# Altium project DIGITAL_TWIN_SOC_TAG.PrjPcb
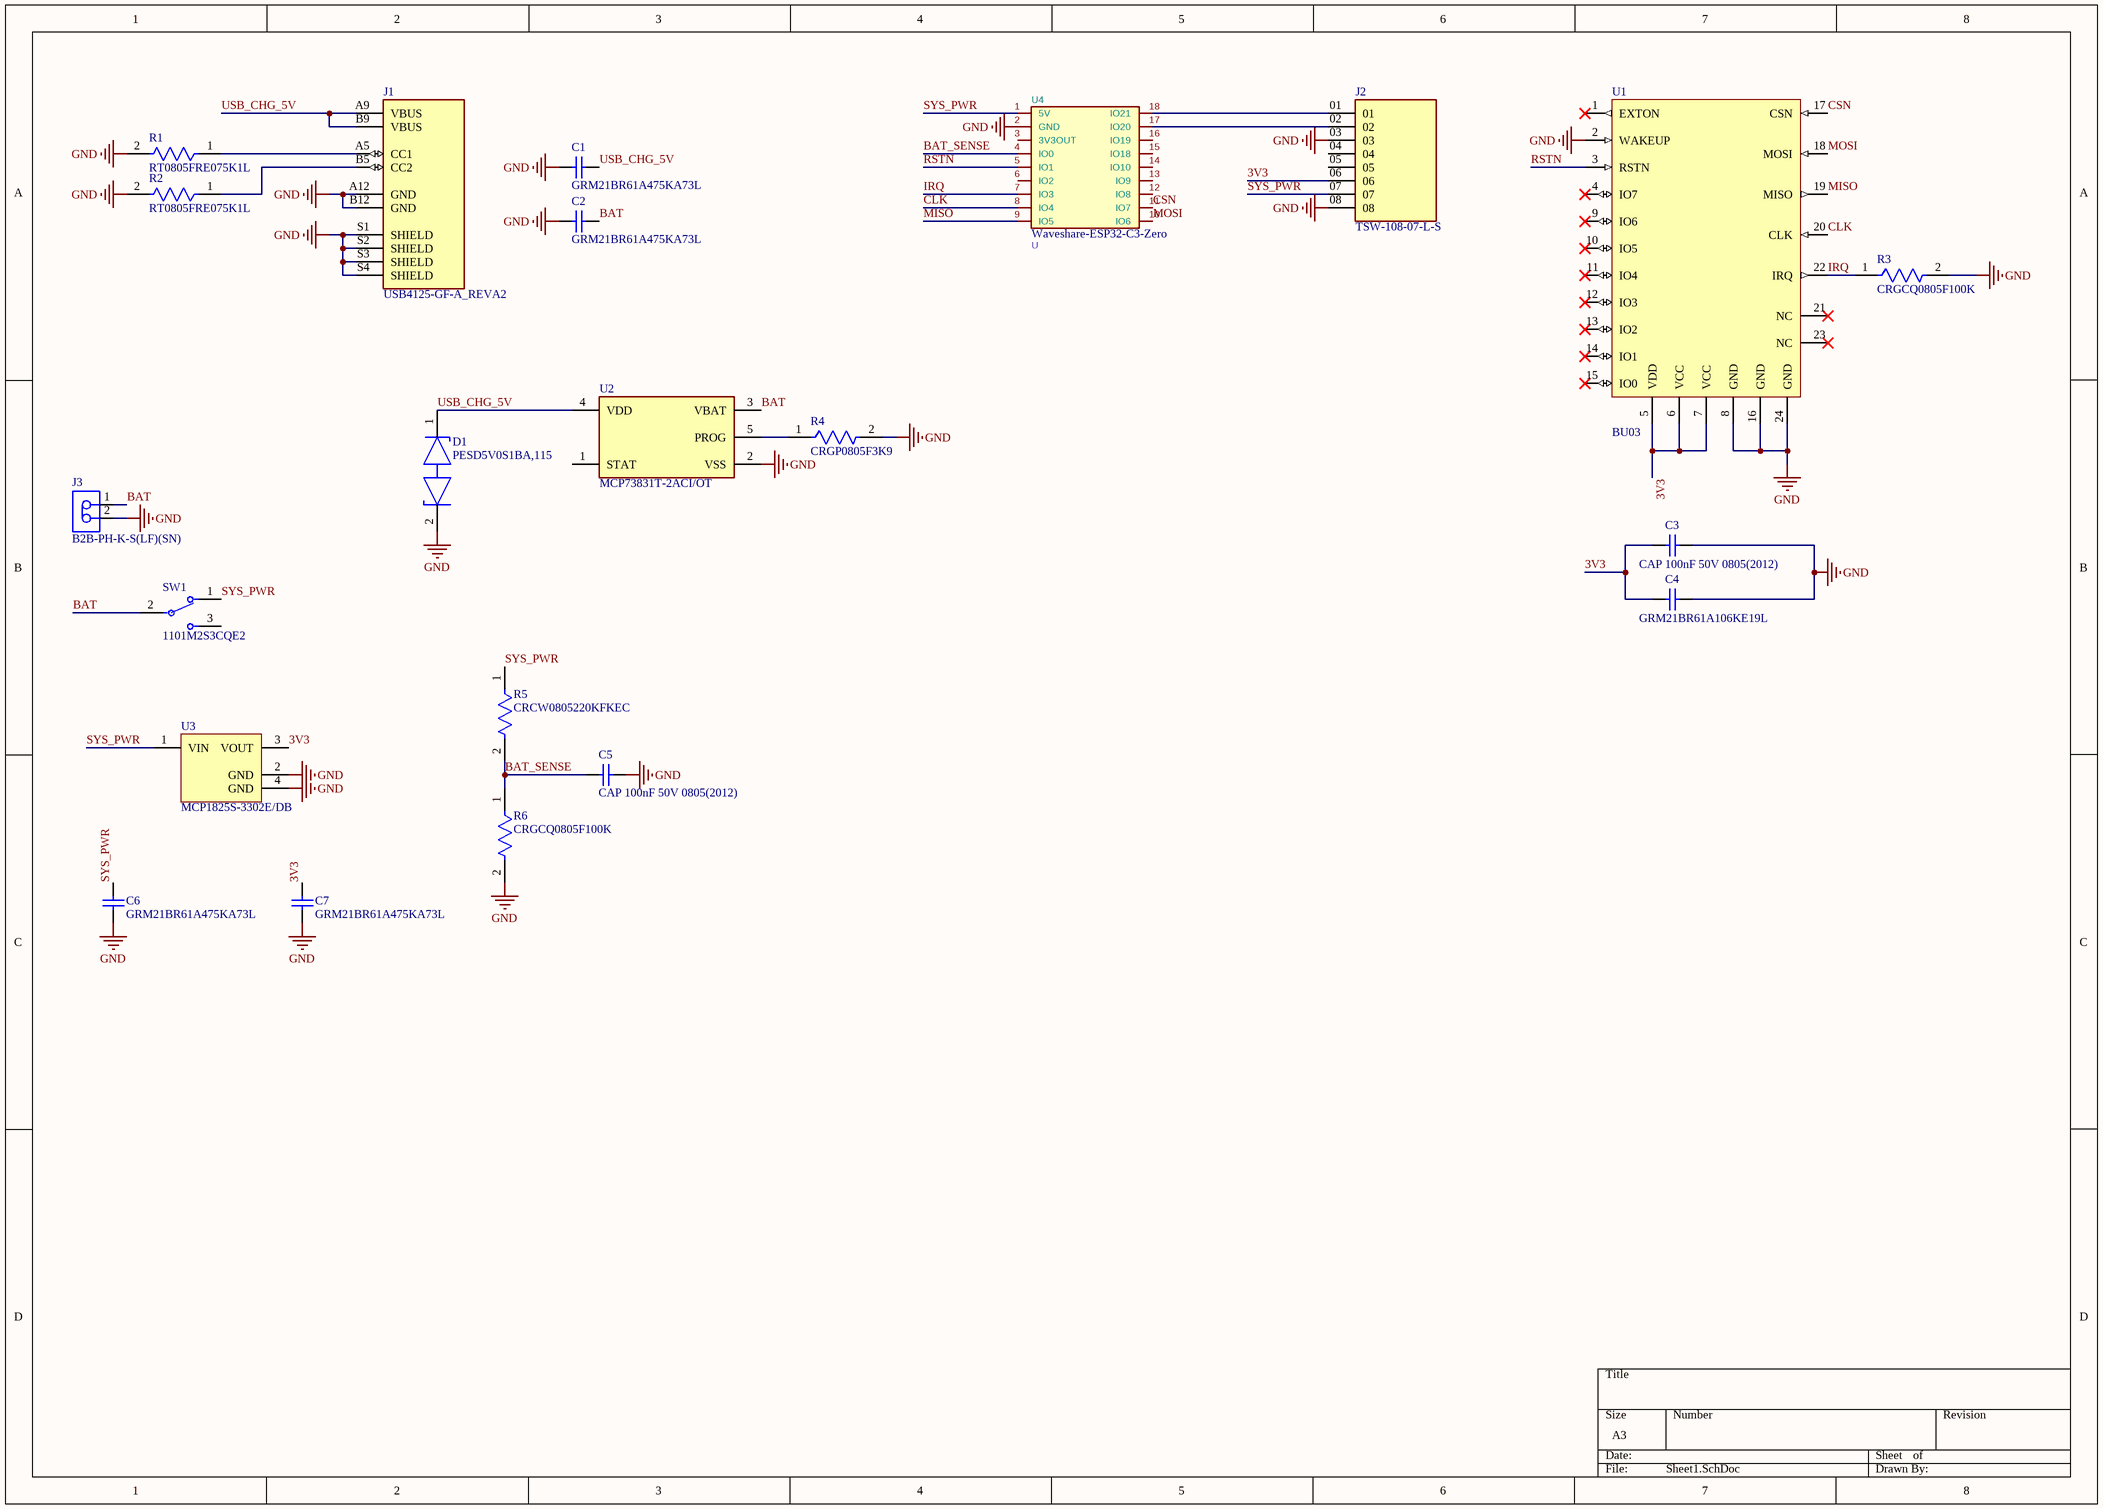
[diagram p0: Sheet1.SchDoc]
1 sheet, 22 parts. Net scope: global (net labels, ports and power ports of the same name join across sheets).
Board file: PCB1.PcbDoc

## Sheet Sheet1.SchDoc
size A3; SheetNumber: 1; SheetTotal: 1

### Parts
C1  GRM21BR61A475KA73L  [CAPC2013X140X45NL15T25]
C2  GRM21BR61A475KA73L  [CAPC2013X140X45NL15T25]
C3  CAP 100nF 50V 0805(2012)  [CAPC0805(2012)100_L]
C4  GRM21BR61A106KE19L  [MURA-0805_H_1.35_M]
C5  CAP 100nF 50V 0805(2012)  [CAPC0805(2012)100_L]
C6  GRM21BR61A475KA73L  [CAPC2013X140X45NL15T25]
C7  GRM21BR61A475KA73L  [CAPC2013X140X45NL15T25]
D1  PESD5V0S1BA,115  [FP-SOD323-CA-MFG]
J1  USB4125-GF-A_REVA2  [GCT_USB4125-GF-A_REVA2]
J2  TSW-108-07-L-S  [SAMTEC_TSW-108-07-L-S]
J3  B2B-PH-K-S(LF)(SN)  [JST-B2B-PH-K-S_V]
R1  RT0805FRE075K1L  [FP-RT0805-MFG]
R2  RT0805FRE075K1L  [FP-RT0805-MFG]
R3  CRGCQ0805F100K  [FP-CRGCQ0805-IPC_C]
R4  CRGP0805F3K9  [FP-CRGP0805-IPC_C]
R5  CRCW0805220KFKEC  [FP-CRCW0805-e3-IPC_B]
R6  CRGCQ0805F100K  [FP-CRGCQ0805-IPC_C]
SW1  1101M2S3CQE2  [FP-1101M2S3CQE2-MFG]
U1  BU03  [BU03-MODE-24PIN-T]
U2  MCP73831T-2ACI/OT  [FP-C04-091-OT-IPC_B]
U3  MCP1825S-3302E/DB  [SOT-223-DB3_N]
U4  Waveshare-ESP32-C3-Zero  Reference: U  [Waveshare-ESP32-C3-Zero]

### Nets
GND: C1.2 C2.2 C3.2 C4.1 C5.2 C6.2 C7.2 D1.2(K2) J1.A12(GND) J1.B12(GND) J1.S1(SHIELD) J1.S2(SHIELD) J1.S3(SHIELD) J1.S4(SHIELD) J2.03 J2.08 J3.2 R1.2 R2.2 R3.2 R4.2 R6.2 U1.2(WAKEUP) U1.8(GND) U1.16(GND) U1.24(GND) U2.2(VSS) U3.2(GND) U3.4(GND) U4.2(GND)
3V3: C3.1 C4.2 C7.1 J2.06 U1.5(VDD) U1.6(VCC) U1.7(VCC) U3.3(VOUT)
BAT: C2.1 J3.1 SW1.2(COMM) U2.3(VBAT)
BAT_SENSE: C5.1 R5.2 R6.1 U4.4(IO0)
CLK: U1.20(CLK) U4.8(IO4)
CSN: U1.17(CSN) U4.11(IO7)
IRQ: R3.1 U1.22(IRQ) U4.7(IO3)
MISO: U1.19(MISO) U4.9(IO5)
MOSI: U1.18(MOSI) U4.10(IO6)
RSTN: U1.3(RSTN) U4.5(IO1)
SYS_PWR: C6.1 J2.07 R5.1 SW1.1 U3.1(VIN) U4.1(5V)
USB_CHG_5V: C1.1 D1.1(K1) J1.A9(VBUS) J1.B9(VBUS) U2.4(VDD)
NetJ1_A5: J1.A5(CC1) R1.1
NetJ1_B5: J1.B5(CC2) R2.1
NetJ2_01: J2.01 U4.18(IO21)
NetJ2_02: J2.02 U4.17(IO20)
NetR4_1: R4.1 U2.5(PROG)

Not connected (* = marked no-connect by the designer): J2 04 05; SW1 3; U1 1(EXTON)* 4(IO7)* 9(IO6)* 10(IO5)* 11(IO4)* 12(IO3)* 13(IO2)* 14(IO1)* 15(IO0)* 21(NC)* 23(NC)*; U2 1(STAT); U4 3(3V3OUT) 6(IO2) 12(IO8) 13(IO9) 14(IO10) 15(IO18) 16(IO19)

### Library data of the parts
C1 C2 C6 C7 = CMP-2007-03391-1: Manufacturer: Murata; Part Number: GRM21BR61A475KA73L
C3 C5 = CMP-1036-04418-1: CAP 100nF 50V ±5% 0805 (2012 Metric) Thickness 1mm SMD; Case-EIA: 0805; Tolerance: Â±5%; Case-Metric: 2012; Max Thickness: 1 mm; Technology: SMT; Value: 100nF; Rated Voltage: 50 V
C4 = CMP-2000-05254-1: CAP, Ceramic, 10 uF, 10%, 10 V, 0805, RoHS, Tape and Reel; Manufacturer: Murata; Voltage - Rated: 10V; Product Training Modules: High-CapMultilayerCeramicCapacitors; Catalog Drawings: GRMSeries_0805_1.25; Temperature Coefficient: X5R; Online Catalog: GRMSeries; Featured Product: GA3SafetyRecognizedCapsandHi-CapMLCC; Capacitance: 10µF; Other Names: 490-1709-6; Applications: GeneralPurpose; Category: Capacitors; Datasheet Version: Aug-14; Datasheet URL: https://datasheet.ciiva.com/3777/210grm21br61a106ke1923-3777175.pdf; Ratings: -; Height - Seated (Max): -; Lead Spacing: -; Operating Temperature: -55degC~85degC; Features: -; Package Description: 2-Pin Surface Mount Device (0805), Body 2.1 x 1.35 mm; Standard Package: 1; Mounting Type: SurfaceMount,MLCC; Package Reference: 805; Tolerance: ±10%; Manufacturer URL: http://www.murata.com/; Size / Dimension: 0.079"Lx0.049"W(2.00mmx1.25mm); Packaging: Digi-Reel; Thickness (Max): 0.053"(1.35mm); Package / Case: 0805(2012Metric); Family: CeramicCapacitors; Series: GRM; Lead Style: -
D1 = CMP-14432-000001-1: TVS DIODE 5V 14V SOD323
J2 = TSW-108-07-L-S: MF: Samtec Inc.; Availability: Unavailable; Price: None; Package: None; Value: *; MP: TSW-108-07-L-S
J3 = CMP-2000-05162-1: Male Header, Pitch 2 mm, 1 x 2 Position, Height 6 mm, Tail Length 3.4 mm, -25 to 85 degC, RoHS, Bulk; Manufacturer: JST; Pitch: 2mm; Style/Orientation: StraightHeader/Plug; No of Positions: 2; Datasheet Version: Nov-08; Datasheet URL: http://datasheet.octopart.com/B2B-PH-K-S%28LF%29%28SN%29-JST-datasheet-8324864.pdf; Manufacturer URL: http://www.jst.com/home2.html; Type: ShroudedHeader; Termination: Crimp
R1 R2 = CMP-2001-01539-2: RES SMD 5.1K OHM 1% 1/8W 0805; Manufacturer: Yageo; Temperature Coefficient: 50 ppm/°C; Tolerance: 0.0001; Value: 5.1KΩ; Voltage Rating: 150V; Power Rating: 0.125W; Ipc Land Pattern Name: RESC200125X50; Digikey Description: RES SMD 5.1K OHM 1% 1/8W 0805; Composition: Thin Film; Category: Res; Device Class L2: Resistors; Manufacturer Part Number: RT0805FRE075K1L; Octopart: https://octopart.com/rt0805fre075k1l-yageo-1396245; Series: RT; Lead Free: Yes; ComponentLink2URL: http://www.yageo.com/documents/recent/PYu-RT_1-to-0.01_RoHS_L_9.pdf; Height: 0.6mm; Device Class L1: Passive Components; Footprint Url: http://www.yageo.com/exep/pages/download/literatures/PYu-R_Mount_10.pdf; Package: RT0805; Temperature Range Low: -55°C; Automotive: No; RoHS: TRUE; Temperature Range High: +155°C; Resistance: 5.1KΩ; Temperature: -55°C to +155°C; ComponentLink2Description: Datasheet; Mouser Description: Res Thin Film 0805 5.1K Ohm 1% 1/8W ±50ppm/°C Molded SMD SMD Paper T/R; Device Class L3: Chip SMD Resistors
R3 R6 = CMP-03211-000816-1: CRGCQ 0805 100K 1%; Manufacturer: TE Connectivity; Tolerance: 0.01; Power Rating: 0.125W; Resistance: 100KΩ; Value: 100KΩ; Temperature Coefficient: ±100ppm/°C; Voltage Rating: 150V; RoHS: TRUE; ComponentLink2URL: https://www.te.com/commerce/DocumentDelivery/DDEController?Action=showdoc&DocId=Data+Sheet%7F1773204-3%7F1%7Fpdf%7FEnglish%7FENG_DS_1773204-3_1.pdf%7F4-2176341-1150; Category: Res; Device Class L2: Resistors; Height: 0.65mm; Ambient Temperature Range High: +70°C; Ipc Land Pattern Name: RESC200125X55; Octopart: https://octopart.com/crgcq0805f100k-te+connectivity-91018138; Digikey Description: CRGCQ 0805 100K 1%; Temperature Range High: +155°C; Lead Free: Yes; Automotive: Yes; Temperature Range Low: -55°C; Device Class L1: Passive Components; Device Class L3: Chip SMD Resistors; Mouser Description: Res Thick Film 0805 100K Ohm 1% 0.125W(1/8W) ±100ppm/C Pad SMD Automotive T/R; Temperature: -55°C to +155°C; Composition: Thick Film; ComponentLink2Description: Datasheet; Automotive Grade: Grade 1141; Package: CRGCQ0805; Manufacturer Part Number: CRGCQ0805F100K; Series: CRGCQ
R4 = CMP-03211-007843-1: CRGP0805 3.9KΩ 0.33W ±100ppm/°C 1% 150V; Manufacturer: TE; Tolerance: 0.01; Temperature Range High: +155°C; Voltage Rating: 150V; Series: CRGP; Height: 0.65mm; Ipc Land Pattern Name: RESC200125X55; RoHS: TRUE; Resistance: 3.9KΩ; ComponentLink2URL: https://www.mouser.com/datasheet/2/418/NG_DS_9-1773463-9_A-1358566.pdf; Package: CRGP0805; Lead Free: Yes; Ambient Temperature Range High: +70°C; Temperature: -55°C to +155°C; Manufacturer Part Number: CRGP0805F3K9; Device Class L3: Chip SMD Resistors; Device Class L2: Resistors; Composition: Thick Film; Automotive: No; Device Class L1: Passive Components; Category: Res; Value: 3.9KΩ; ComponentLink2Description: Datasheet; Temperature Coefficient: ±100ppm/°C; Power Rating: 0.33W; Octopart: https://octopart.com/crgp0805f3k9-te+connectivity-91018820; Temperature Range Low: -55°C
R5 = CMP-02407-007376-1: RES Thick Film, 220kΩ, 1%, 0.125W, 100ppm/°C, 0805; Max Power Dissipation: 125mW; Resistance: 220kR; Width: 0.049inch; Composition: Thick Film; Max Operating Temperature: 155°C; Min Operating Temperature: -55°C; Length: 0.079inch; Package Quantity: 20000; Features: Automotive AEC-Q200; Packaging: Tape and Reel; Height: 0.02inch; Case/Package: 0805; Temperature Coefficient: 100ppm/°C; Lead Free: Lead Free; Number of Terminations: 2; Tolerance: 1%
SW1 = CMP-10038-000019-1: SWITCH SLIDE SPDT 6A 120V; Switch Travel: 2.16mm; Number of Positions: 3; Number of Poles: 1; Approvals: UL; Actuator Length: 5.08mm; Voltage Rating (DC): 28V; Max Voltage Rating (AC): 250V; Insulation Resistance: 1GR; Body Material: Stainless Steel; Actuator Type: Standard; Contact Resistance: 10mR; Switch Function: On-On; Actuator Material: Nylon; Actuator Color: Black; Electrical Life: 40000Cycles; Termination: PC Pins; Packaging: Bulk; Housing Material: Stainless Steel; Flammability Rating: UL94 V-0; Series: 1000; Contact Current Rating: 6A; Length: 12.7mm; Depth: 6.6mm; Orientation: Vertical; Max Current Rating: 6A; Max Operating Temperature: 65°C; Throw Configuration: SPDT; REACH SVHC: No SVHC; Contact Material: Copper; Max Voltage Rating (DC): 28V; Lead Free: Lead Free; Current Rating: 6A; Voltage Rating (AC): 120V; Contact Plating: Silver; Package Quantity: 1; Min Operating Temperature: -30°C; Mount: Through Hole
U2 = CMP-0133-00143-2: IC CONTROLLR LI-ION 4.2V SOT23-5; Max Power Dissipation: 1.54W; Output Current: 500mA; Max Output Voltage: 4.5V; Number of Outputs: 1; Min Output Voltage: 4.168V; Min Supply Voltage: 3.75V; Max Input Voltage: 6V; Voltage Rating: 4.534V; Drain to Source Resistance: 350mR; Max Operating Temperature: 85°C; Length: 0.122inch; Number of Pins: 5; REACH SVHC: No SVHC; Radiation Hardening: No; Min Operating Temperature: -40°C; Weight: 0.00709oz; Contact Plating: Tin; Termination: SMD/SMT; Case/Package: SOT-23; Mount: Surface Mount; Width: 0.071inch; Packaging: Tape and Reel; Number of Cells: 1; Max Charge Current: 500mA; Height: 0.051inch; Number of Channels: 1; Output Voltage: 4.2V; Max Supply Voltage: 6V; Lead Free: Lead Free
U3 = CMP-0136-00458-1: 500 mA, Low Voltage, Low Quiescent Current LDO Regulator, 3-Pin SOT-223, Extended Temperature; PackageReference: SOT-223-DB3; PackageDescription: 3-Lead Plastic Small Outline Transistor (DB) [SOT-223]; PackageVersion: revBB, Aug-2009; DatasheetVersion: revB, Feb-2008
J1 = USB4125-GF-A_REVA2: Package: None; Availability: Unavailable; MP: USB4125-GF-A_REVA2; Value: *; Price: None
U4 = Waveshare-ESP32-C3-Zero: Footprint: Waveshare-ESP32:Waveshare-ESP32-C3-Zero; Datasheet: https://www.waveshare.com/wiki/ESP32-C3-Zero